# Altium schematic sheet BUTTONS.SchDoc
size A4; SheetNumber: 4; SheetTotal: 9
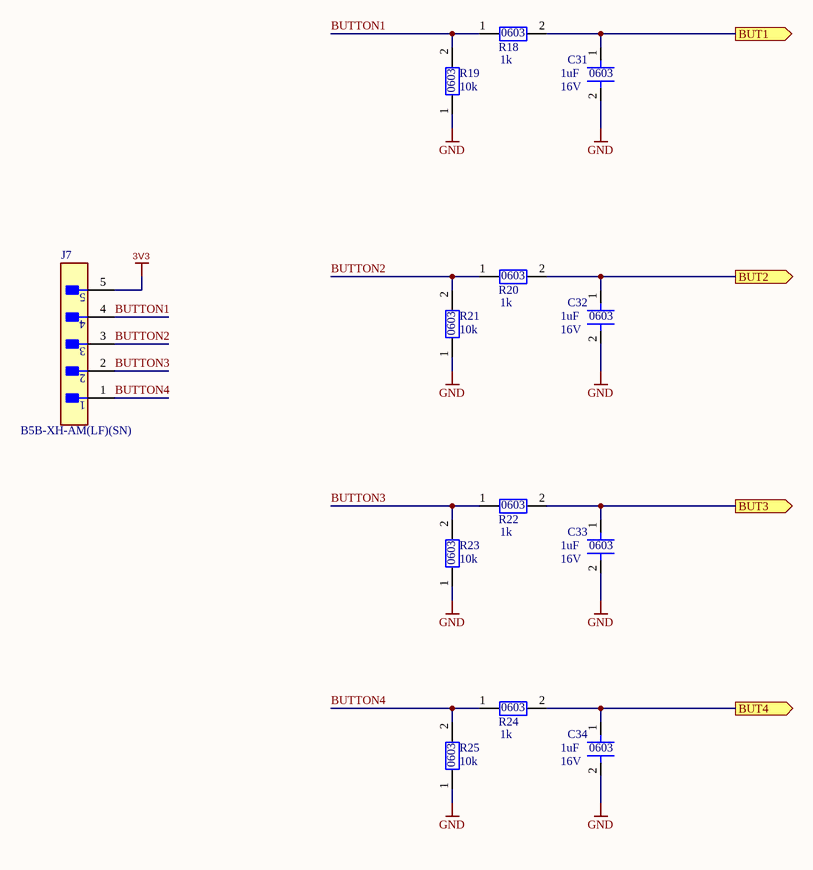
[diagram p0: BUTTONS.SchDoc]

## Parts
C31  SMD 0603 Capacitor  [CAPACITOR_SMD_0603]  (value not drawn)
C32  SMD 0603 Capacitor  [CAPACITOR_SMD_0603]  (value not drawn)
C33  SMD 0603 Capacitor  [CAPACITOR_SMD_0603]  (value not drawn)
C34  SMD 0603 Capacitor  [CAPACITOR_SMD_0603]  (value not drawn)
J7  B5B-XH-AM(LF)(SN)  [FP-B5B-XH-AM_LF_SN-MFG]
R18  SMD 0603 Resistor  [RESISTOR_SMD_0603]  (value not drawn)
R19  SMD 0603 Resistor  [RESISTOR_SMD_0603]  (value not drawn)
R20  SMD 0603 Resistor  [RESISTOR_SMD_0603]  (value not drawn)
R21  SMD 0603 Resistor  [RESISTOR_SMD_0603]  (value not drawn)
R22  SMD 0603 Resistor  [RESISTOR_SMD_0603]  (value not drawn)
R23  SMD 0603 Resistor  [RESISTOR_SMD_0603]  (value not drawn)
R24  SMD 0603 Resistor  [RESISTOR_SMD_0603]  (value not drawn)
R25  SMD 0603 Resistor  [RESISTOR_SMD_0603]  (value not drawn)

## Ports
BUT1 (out, see MAIN_SCHEMATIC[2B], STM32[3A]), BUT2 (out, see MAIN_SCHEMATIC[2B], STM32[3A]), BUT3 (out, see MAIN_SCHEMATIC[2C], STM32[3A]), BUT4 (out, see MAIN_SCHEMATIC[2C], STM32[3B])

## Nets
3V3: J7.5
GND: C31.2 C32.2 C33.2 C34.2 R19.1 R21.1 R23.1 R25.1
BUT1: C31.1 R18.2 ; port BUT1
BUT2: C32.1 R20.2 ; port BUT2
BUT3: C33.1 R22.2 ; port BUT3
BUT4: C34.1 R24.2 ; port BUT4
BUTTON1: J7.4 R18.1 R19.2
BUTTON2: J7.3 R20.1 R21.2
BUTTON3: J7.2 R22.1 R23.2
BUTTON4: J7.1 R24.1 R25.2

## Notes on the sheet
- (near R19) 10k
- (near R18) 1k
- (near C31) 1uF
- (near C31) 16V
- (near R21) 10k
- (near R20) 1k
- (near C32) 1uF
- (near C32) 16V
- (near R23) 10k
- (near R22) 1k
- (near C33) 1uF
- (near C33) 16V
- (near R25) 10k
- (near R24) 1k
- (near C34) 1uF
- (near C34) 16V
- (in symbol SMD 0603 Capacitor) 0603
- (in symbol SMD 0603 Resistor) 0603

## Library data of the parts
C31-C34 = SMD 0603 Capacitor: 0603 capacitor
J7 = CMP-17439-000304-1: CONN HEADER VERT 5POS 2.5MM; Mated Stacking Heights: 9.8mm; Voltage Rating: 250V; Max Current Rating: 3A; Number of Positions: 5; Contact Resistance: 20mR; Depth: 5.75mm; Connector Type: Header; Color: Green; Insulation Material: Nylon; Contact Plating: Copper; Length: 14.9mm; Fastening Type: Detent; Contact Material: Brass; Number of Rows: 1; Contact Type: Male Pin; Housing Material: Polyamide; Housing Color: White; Lead Free: Lead Free; Max Voltage Rating (AC): 250V; Mount: Through Hole; Contact Shape: Square; Min Operating Temperature: -25°C; Packaging: Bulk; Orientation: Straight; Insulation Color: Natural; Series: XH; Flammability Rating: UL94 V-0; Contact Finish - Mating: TIN; Max Operating Temperature: 85°C; Termination: Solder; Pitch: 2.5mm
R18-R25 = SMD 0603 Resistor: 0603 resistor